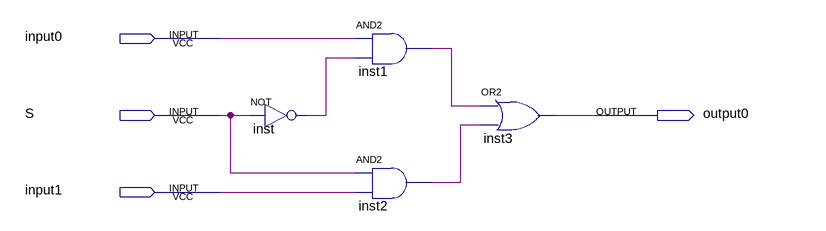
[diagram p0: schematic sheet]
// Quartus schematic 2to1mux.bdf as structural Verilog: 4 symbols, 4 pins
module \2to1mux  (
  input  input0,
  input  S,
  input  input1,
  output output0
);

  wire inst1_out, inst2_out, inst_out;

  not inst (inst_out, S);
  and inst1 (inst1_out, input0, inst_out);
  and inst2 (inst2_out, S, input1);
  or inst3 (output0, inst1_out, inst2_out);
endmodule
